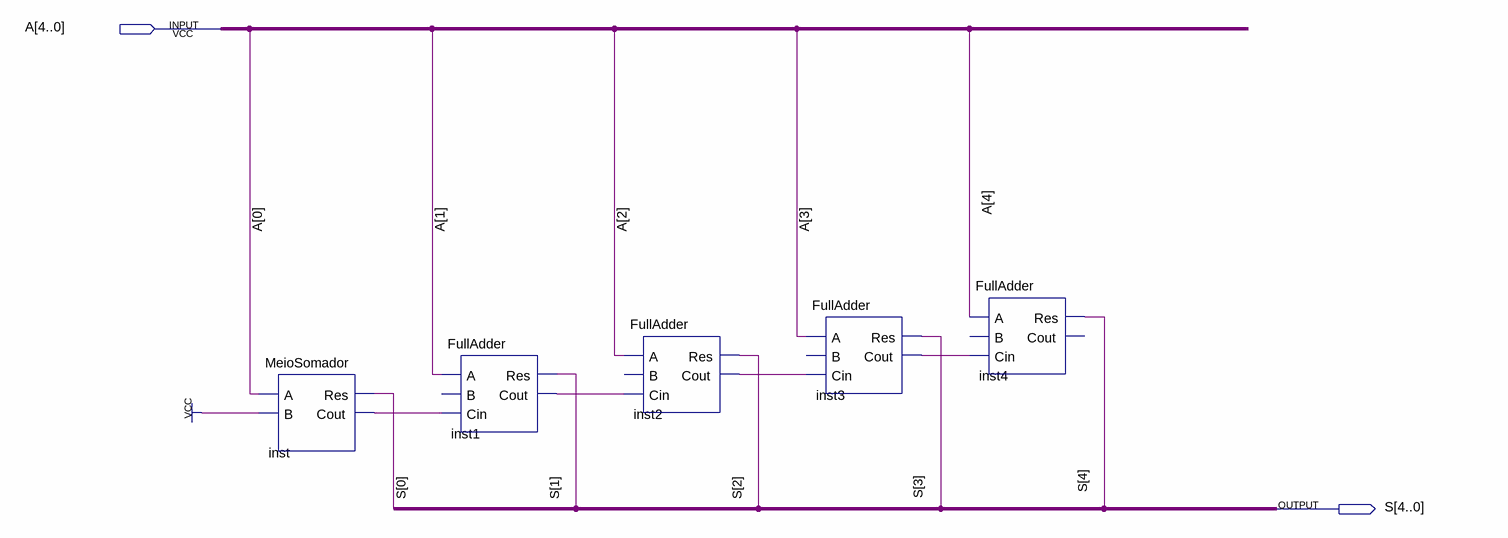
[diagram p0: schematic sheet]
// Quartus schematic soma_1.bdf as structural Verilog: 5 symbols, 2 pins
module soma_1 (
  input  [4:0] A,
  output [4:0] S
);

  wire inst1_cout, inst2_cout, inst3_cout, inst_cout;

  MeioSomador inst (.A(A[0]), .B(1'b1), .Res(S[0]), .Cout(inst_cout));
  FullAdder inst1 (.A(A[1]), .Cin(inst_cout), .Res(S[1]), .Cout(inst1_cout));  // open: B
  FullAdder inst2 (.A(A[2]), .Cin(inst1_cout), .Res(S[2]), .Cout(inst2_cout));  // open: B
  FullAdder inst3 (.A(A[3]), .Cin(inst2_cout), .Res(S[3]), .Cout(inst3_cout));  // open: B
  FullAdder inst4 (.A(A[4]), .Cin(inst3_cout), .Res(S[4]));  // open: B, Cout
endmodule
